# Altium project Breakout_Board_PAC5527.PrjPcb (part 1 of 2)
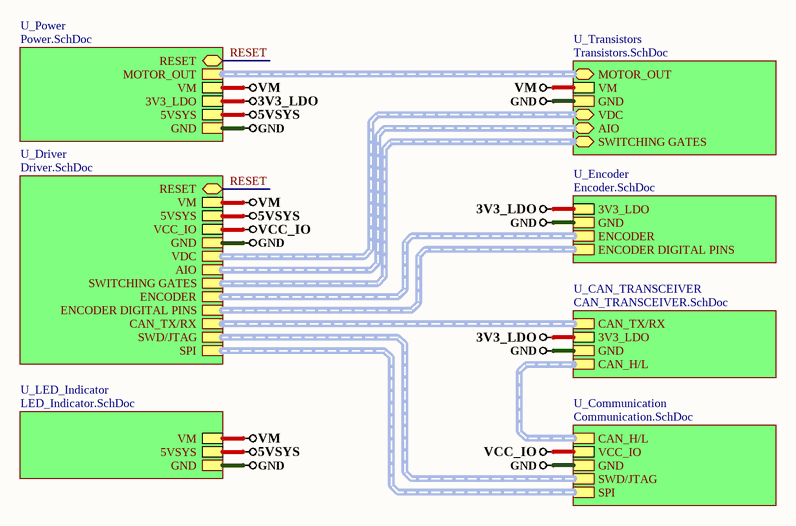
[diagram p0: Top_Sheet.SchDoc]
8 sheets, 84 parts. Net scope: hierarchical (ports join the sheet entries above them; power ports are global).
Board file: BOB_PAC5527.PcbDoc
Sheets:
  Top_Sheet.SchDoc
    U_Communication = Communication.SchDoc
    U_LED_Indicator = LED_Indicator.SchDoc
    U_Transistors = Transistors.SchDoc
    U_CAN_TRANSCEIVER = CAN_TRANSCEIVER.SchDoc
    U_Power = Power.SchDoc
    U_Encoder = Encoder.SchDoc
    U_Driver = Driver.SchDoc

## Sheet Top_Sheet.SchDoc
size A4; DocumentNumber: 8; SheetNumber: 1; SheetTotal: 8

### Sub-sheets
U_CAN_TRANSCEIVER = CAN_TRANSCEIVER.SchDoc: CAN_H/L (harness CAN_H/L), CAN_TX/RX (harness CAN_TXRX), GND, 3V3_LDO
U_Communication = Communication.SchDoc: SWD/JTAG (harness SWD/JTAG), SPI (harness SPI), GND, VCC_IO, CAN_H/L (harness CAN_H/L)
U_Driver = Driver.SchDoc: SWITCHING GATES (harness SWITCHING GATES), AIO (harness AIO), GND, SWD/JTAG (harness SWD/JTAG), CAN_TX/RX (harness CAN_TX/RX), VCC_IO, VDC (harness VDC), 5VSYS, VM, RESET (bidir), SPI (harness SPI), ENCODER (harness ENCODER), ENCODER DIGITAL PINS (harness ENCODER DIGITAL PINS)
U_Encoder = Encoder.SchDoc: GND, 3V3_LDO, ENCODER (harness ENCODER), ENCODER DIGITAL PINS (harness ENCODER DIGITAL PINS)
U_LED_Indicator = LED_Indicator.SchDoc: 5VSYS, GND, VM
U_Power = Power.SchDoc: GND, VM, MOTOR_OUT (harness MOTOR_OUT), RESET (bidir), 3V3_LDO, 5VSYS
U_Transistors = Transistors.SchDoc: MOTOR_OUT (bidir, harness MOTOR_OUT), VDC (bidir, harness VDC), GND, VM, AIO (bidir, harness AIO), SWITCHING GATES (bidir, harness SWITCHING GATES)

### Nets
3V3_LDO: sheet U_CAN_TRANSCEIVER/3V3_LDO, sheet U_Power/3V3_LDO, sheet U_Encoder/3V3_LDO
5VSYS: sheet U_LED_Indicator/5VSYS, sheet U_Power/5VSYS, sheet U_Driver/5VSYS
GND: sheet U_Communication/GND, sheet U_LED_Indicator/GND, sheet U_Transistors/GND, sheet U_CAN_TRANSCEIVER/GND, sheet U_Power/GND, sheet U_Encoder/GND, sheet U_Driver/GND
VCC_IO: sheet U_Communication/VCC_IO, sheet U_Driver/VCC_IO
VM: sheet U_LED_Indicator/VM, sheet U_Transistors/VM, sheet U_Power/VM, sheet U_Driver/VM
RESET: sheet U_Power/RESET, sheet U_Driver/RESET

### Buses and harness runs
harness sheet U_CAN_TRANSCEIVER/CAN_H/L = sheet U_Communication/CAN_H/L
harness sheet U_CAN_TRANSCEIVER/CAN_TX/RX = sheet U_Driver/CAN_TX/RX
harness sheet U_Communication/SPI = sheet U_Driver/SPI
harness sheet U_Communication/SWD/JTAG = sheet U_Driver/SWD/JTAG
harness sheet U_Driver/AIO = sheet U_Transistors/AIO
harness sheet U_Driver/ENCODER = sheet U_Encoder/ENCODER
harness sheet U_Driver/ENCODER DIGITAL PINS = sheet U_Encoder/ENCODER DIGITAL PINS
harness sheet U_Driver/SWITCHING GATES = sheet U_Transistors/SWITCHING GATES
harness sheet U_Driver/VDC = sheet U_Transistors/VDC
harness sheet U_Power/MOTOR_OUT = sheet U_Transistors/MOTOR_OUT

### Notes on the sheet
- File:
- Title:
- Date:
- Page
- Num:
- Total:
- Drawn By: Huzaifa Ali

## Sheet Communication.SchDoc
size A4; DocumentNumber: 4; SheetNumber: 5; SheetTotal: 8
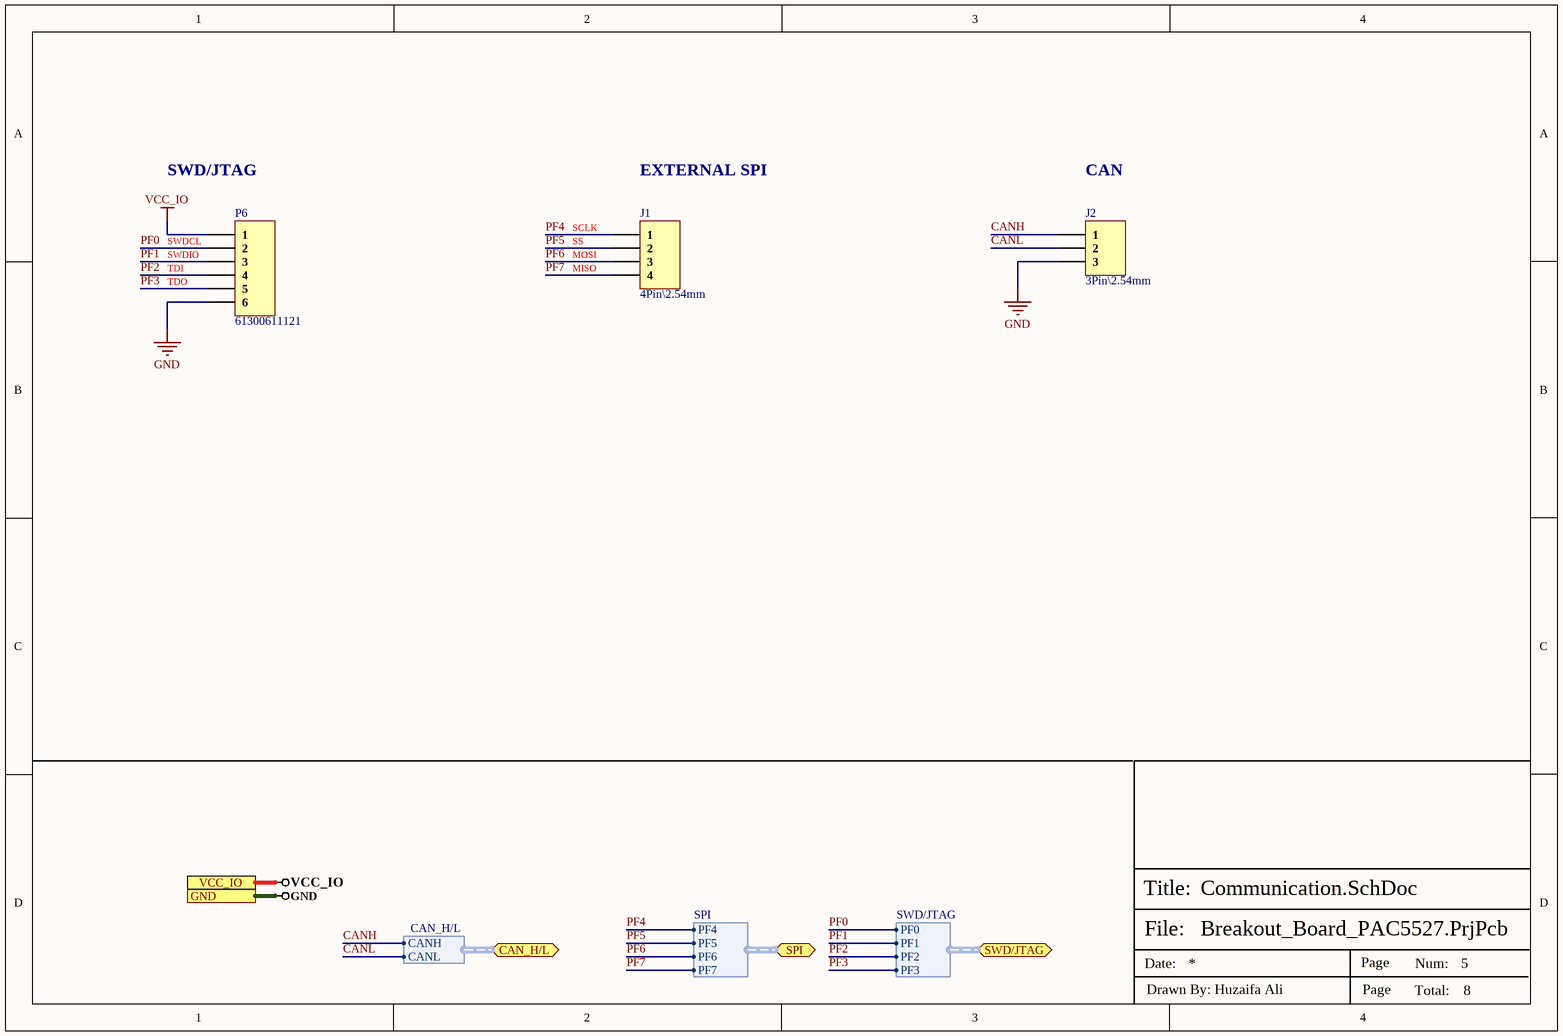
[diagram p1: Communication.SchDoc]

### Parts
J1  4Pin\2.54mm  [HDR1X4_]
J2  3Pin\2.54mm  [HDR1X3_]
P6  61300611121  [HDR1X6_]

### Ports
CAN_H/L (bidir, harness CAN_H/L), GND, SPI (bidir, harness SPI), SWD/JTAG (bidir, harness SWD/JTAG), VCC_IO

### Harnesses
SWD/JTAG: PF0, PF1, PF2, PF3
SPI: PF4, PF5, PF6, PF7
CAN_H/L: CANH, CANL

### Nets
GND: J2.3 P6.6 ; port GND
VCC_IO: P6.1 ; port VCC_IO
CANH: J2.1 ; port CAN_H/L.CANH
CANL: J2.2 ; port CAN_H/L.CANL
PF0: P6.2 ; port SWD/JTAG.PF0
PF1: P6.3 ; port SWD/JTAG.PF1
PF2: P6.4 ; port SWD/JTAG.PF2
PF3: P6.5 ; port SWD/JTAG.PF3
PF4: J1.1 ; port SPI.PF4
PF5: J1.2 ; port SPI.PF5
PF6: J1.3 ; port SPI.PF6
PF7: J1.4 ; port SPI.PF7

### Notes on the sheet
- SWD/JTAG
- EXTERNAL SPI
- CAN
- (near P6) SWDCL
- SS
- (near J1) SCLK
- (near P6) SWDIO
- (near P6) TDO
- (near P6) TDI
- (near J1) MISO
- (near J1) MOSI
- File:
- Title:
- Date:
- Page
- Num:
- Total:
- Drawn By: Huzaifa Ali

### Library data of the parts
J1 = B-2100S04P-A110: Straight 2.54mm 6mm -40℃~+105℃ 3mm 4 2.54mm 单排 Black Brass 1x4P Plugin,P=2.54mm Pin Headers ROHS; Manufacturer: Ckmtw; Item Type: Header; LCSC Part Number: C124378; Manufacturer Part Number: B-2100S04P-A110
J2 = B-2100S03P-A110: Straight 2.54mm Black Brass 1x3P Plugin,P=2.54mm Pin Headers ROHS; Manufacturer: Ckmtw; Item Type: Header; LCSC Part Number: C124376; Manufacturer Part Number: B-2100S03P-A110
P6 = 61300611121: CONN HEADER 6 POS 2.54; Manufacturer: Wurth Electronics; Current Rating: 3A; Voltage Rating: 250V; Number of Positions: 6; Gender: Male; Connector Type: Male Pin; Pitch: 0.1inch; Supplier 1: Newark; Manufacturer Part Number: 61300611121; RoHS: Yes; Category: Headers and Wire Housings; Stock 1: 4996; Pricing 1: 1=0.34000, 10=0.28900, 25=0.24000, 50=0.20100, 100=0.18200 (USD); Mount: Through Hole; Contact Plating: Gold; Contact Material: Copper Alloy,Copper; Housing Material: PBT; Color: Black; Min Operating Temperature: -40°C; Max Operating Temperature: 125°C; Number of Rows: 1; Contact Gender: Male; Packaging: Bulk; Termination: Through Hole; Number of Contacts: 6; Series: WR-PHD; Contact Type: Male Pin; Contact Mating Length: 0.236inch; REACH SVHC: Unknown; Lead Free: Lead Free; RoHS Compliant: Yes; ComponentLink1URL: http://www.mouser.com/ds/2/445/6130xx11121-538006.pdf?src-supplier=Mouser; ComponentLink1Description: http://www.mouser.com/ds/2/445/6130xx11121-538006.pdf?src-supplier=Mouser; ComponentLink2URL: http://www.farnell.com/cad/1737268.pdf?src-supplier=Element14; ComponentLink2Description: http://www.farnell.com/cad/1737268.pdf?src-supplier=Element14; ComponentLink3URL: https://katalog.we-online.de/em/datasheet/6130xx11121.pdf?src-supplier=Digi-Key; ComponentLink3Description: https://katalog.we-online.de/em/datasheet/6130xx11121.pdf?src-supplier=Digi-Key; Supplier Part Number 1: 20X0957

## Sheet LED_Indicator.SchDoc
size A4; DocumentNumber: 6; SheetNumber: 7; SheetTotal: 8
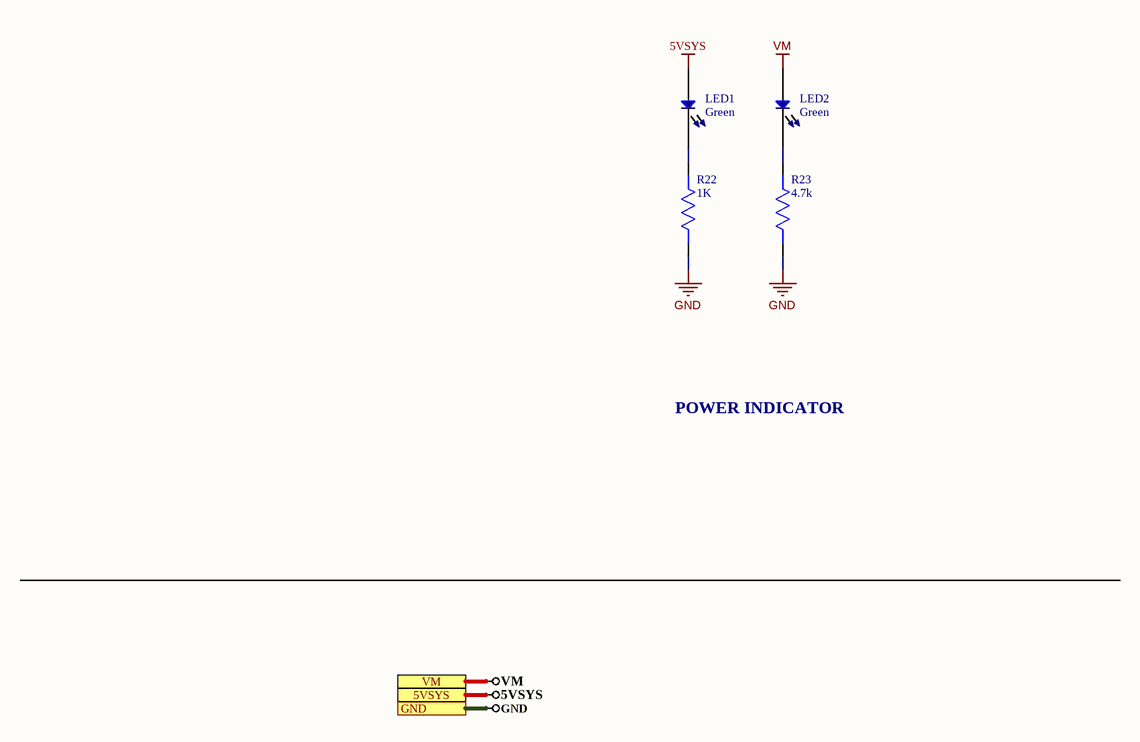
[diagram p2: LED_Indicator.SchDoc]

### Parts
LED1  Green  [LED-0402]
LED2  Green  [LED-0402]
R22  1K  [Res-0402]
R23  4.7k  [RES-0805]

### Ports
5VSYS, GND, VM

### Nets
5VSYS: LED1.1 ; port 5VSYS
GND: R22.2 R23.2 ; port GND
VM: LED2.1 ; port VM
NetLED1_2: LED1.2 R22.1
NetLED2_2: LED2.2 R23.1

### Notes on the sheet
- POWER INDICATOR
- File:
- Title:
- Date:
- Page
- Num:
- Total:
- Drawn By: Huzaifa Ali

### Library data of the parts
LED1 LED2 = 16-213/GHC-YR1S1/3T: Green 520~535nm 0402 Light Emitting Diodes (LED) RoHS; Manufacturer: Everlight Elec; Luminous Intensity (IF=20mA): 112~285mcd; Package: 0402; Illumination Color: Green; Dominant Wavelength / Coordinate rank: 520~535nm; Mounting Type: Surface Mount; Manufacturer Part Number: 16-213/GHC-YR1S1/3T; ComponentLink1Description: LCSC; ComponentLink1URL: https://www.lcsc.com/product-detail/Light-Emitting-Diodes-LED_Everlight-Elec-16-213-GHC-YR1S1-3T_C74338.html; LCSC Part Number: C74338
R22 = ERJ-2GEJ102X: RES SMD 1K OHM 5% 1/10W 0402; Manufacturer: Panasonic; Temperature Coefficient: 200ppm/°C; Working Voltage: 50V; Power: 100mW; Rated Temperature: 70°C; Value: 1kR; Package Height: 0.35mm; Package Length: 1mm; Package Width: 0.5mm; Reference Standard: AEC-Q200; Item Type: Resistor; Supplier 1: Rs; Manufacturer Part Number: ERJ-2GEJ102X; Stock 1: 600000; Pricing 1: 10000=0.00400, 30000=0.00300 (GBP); Case/Package: 0402; Min Operating Temperature: -55°C; Max Operating Temperature: 155°C; Tolerance: 5%; Packaging: Tape and Reel; Termination: Wraparound; ComponentLink1URL: https://datasheet.ciiva.com:443/pdfs/VipMasterIC/IC/PANA/PANA-S-A0009891627/PANA-S-A0009891627-1.pdf?src-supplier=IHS+Markit; ComponentLink1Description: https://datasheet.ciiva.com:443/pdfs/VipMasterIC/IC/PANA/PANA-S-A0009891627/PANA-S-A0009891627-1.pdf?src-supplier=IHS+Markit; ComponentLink2URL: https://datasheet.ciiva.com/34303/1986781-34303542.pdf?src-supplier=Jameco; ComponentLink2Description: https://datasheet.ciiva.com/34303/1986781-34303542.pdf?src-supplier=Jameco; ComponentLink3URL: https://datasheet.ciiva.com/11821/0900766b80f806dd-11821202.pdf?src-supplier=Rs; ComponentLink3Description: https://datasheet.ciiva.com/11821/0900766b80f806dd-11821202.pdf?src-supplier=Rs; ComponentLink4URL: https://datasheet.ciiva.com/43460/1500035-43460379.pdf?src-supplier=Farnell; ComponentLink4Description: https://datasheet.ciiva.com/43460/1500035-43460379.pdf?src-supplier=Farnell; ComponentLink5URL: https://datasheet.ciiva.com/46386/1500035-46386458.pdf?src-supplier=Element14; ComponentLink5Description: https://datasheet.ciiva.com/46386/1500035-46386458.pdf?src-supplier=Element14; ComponentLink6URL: https://datasheet.ciiva.com/22783/1500035-22783817.pdf?src-supplier=Farnell; ComponentLink6Description: https://datasheet.ciiva.com/22783/1500035-22783817.pdf?src-supplier=Farnell; ComponentLink7URL: https://datasheet.ciiva.com/46371/1500035-46371935.pdf?src-supplier=Element14; ComponentLink7Description: https://datasheet.ciiva.com/46371/1500035-46371935.pdf?src-supplier=Element14; ComponentLink8URL: https://datasheet.ciiva.com/16762/70260739-16762170.pdf?src-supplier=Allied+Electronics; ComponentLink8Description: https://datasheet.ciiva.com/16762/70260739-16762170.pdf?src-supplier=Allied+Electronics; ComponentLink9URL: https://datasheet.ciiva.com/16199/aoa0000ce1-16199541.pdf?src-supplier=Future+Electronics; ComponentLink9Description: https://datasheet.ciiva.com/16199/aoa0000ce1-16199541.pdf?src-supplier=Future+Electronics; Supplier Part Number 1: 7324867; RoHS: Yes; Category: Chip SMD Resistors; Mounting Technology: Surface Mount; Pins: 2; Package Shape: Rectangular; Terminal Finish: Nickel; JESD-609 Code: e3; Resistor Type: FIXED RESISTOR; Construction: Rectangular; Package Style: SMTMeter; Technology: METAL GLAZE/THICK FILM; Reach SVHC Compliant: Yes; RoHS Compliant: Yes; ComponentLink10URL: https://datasheet.ciiva.com/48531/aoa0000ce1-48531081.pdf?src-supplier=Avnet; ComponentLink10Description: https://datasheet.ciiva.com/48531/aoa0000ce1-48531081.pdf?src-supplier=Avnet; ComponentLink11URL: https://datasheet.ciiva.com/30219/4aoa0000ce1-30219159.pdf?src-supplier=Onlinecomponents.com; ComponentLink11Description: https://datasheet.ciiva.com/30219/4aoa0000ce1-30219159.pdf?src-supplier=Onlinecomponents.com; LCSC Part Number: *
R23 = CRCW08054K70FKEAHP: Res Thick Film 0805 4.7K Ohm 1% 0.5W ±100ppm/°C Molded SMD SMD Paper T/R; Manufacturer: Vishay; Power Rating: 330mW; Voltage Rating: 150V; Resistance: 4.7kR; Max Power Dissipation: 500mW; Item Type: Resistor; Supplier 1: RSComponents; Manufacturer Part Number: CRCW08054K70FKEAHP; RoHS: Yes; Category: Chip SMD Resistors; Stock 1: 8150; Pricing 1: 100=0.15700, 250=0.14600, 500=0.13600, 1000=0.12500 (GBP); Mount: Surface Mount; Case/Package: 0805; Weight: 0.000194oz; Case Code (Imperial): 0805; Case Code (Metric): 2012; Contact Plating: Tin; Min Operating Temperature: -55°C; Max Operating Temperature: 155°C; Tolerance: 1%; Packaging: Tape and Reel; Package Quantity: 5000; Resistor Type: Thick Film; Termination: SMD/SMT; Temperature Coefficient: 100ppm/°C; Voltage Rating (DC): 150V; Features: Automotive AEC-Q200; Series: CRCW-HP; Number of Terminations: 2; Resistance Tolerance: 1%; Construction: Rectangular; Technology: THICK FILM; Length: 2mm; Width: 1.2mm; Height: 0.5mm; Depth: 1.25mm; Ratings: AEC-Q200; Radiation Hardening: No; Military Standard: Not; Lead Free: Lead Free; RoHS Compliant: Yes; ComponentLink1URL: https://datasheet.ciiva.com/8079/424479-8079653.pdf?src-supplier=Element14; ComponentLink1Description: https://datasheet.ciiva.com/8079/424479-8079653.pdf?src-supplier=Element14; ComponentLink2URL: https://datasheet.ciiva.com/9072/crcwhpe3-9072073.pdf?src-supplier=Avnet; ComponentLink2Description: https://datasheet.ciiva.com/9072/crcwhpe3-9072073.pdf?src-supplier=Avnet; LCSC Part Number: C313926; Supplier Part Number 1: 8123574P

## Sheet Transistors.SchDoc
size A4; DocumentNumber: 5; SheetNumber: 6; SheetTotal: 8
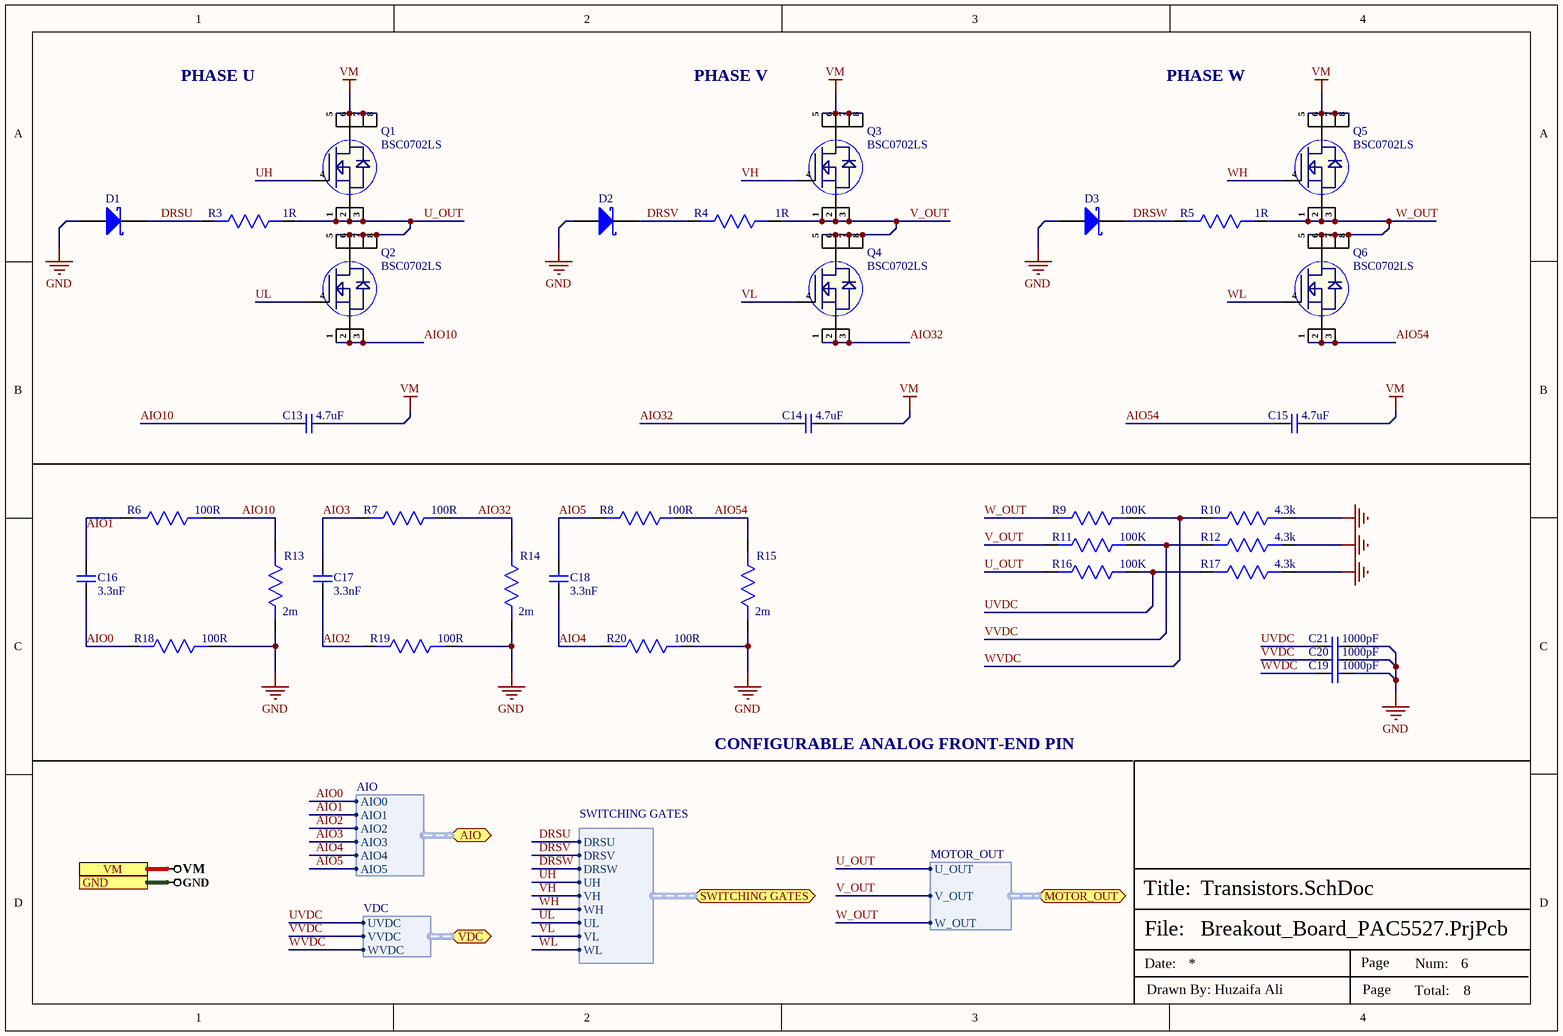
[diagram p3: Transistors.SchDoc]

### Parts
C13  4.7uF  [Cap-0805]
C14  4.7uF  [Cap-0805]
C15  4.7uF  [Cap-0805]
C16  3.3nF  [Cap-0402]
C17  3.3nF  [Cap-0402]
C18  3.3nF  [Cap-0402]
C19  1000pF  [Cap-0402]
C20  1000pF  [Cap-0402]
C21  1000pF  [Cap-0402]
D1  1N4148WS-7-F  [SOD-323]  (value not drawn)
D2  1N4148WS-7-F  [SOD-323]  (value not drawn)
D3  1N4148WS-7-F  [SOD-323]  (value not drawn)
Q1  BSC0702LS  [PG-TDSON-8]
Q2  BSC0702LS  [PG-TDSON-8]
Q3  BSC0702LS  [PG-TDSON-8]
Q4  BSC0702LS  [PG-TDSON-8]
Q5  BSC0702LS  [PG-TDSON-8]
Q6  BSC0702LS  [PG-TDSON-8]
R3  1R  [Res-0402]
R4  1R  [Res-0402]
R5  1R  [Res-0402]
R6  100R  [Res-0402]
R7  100R  [Res-0402]
R8  100R  [Res-0402]
R9  100K  [Res-0402]
R10  4.3k  [Res-0603]
R11  100K  [Res-0402]
R12  4.3k  [Res-0603]
R13  2m  [RES-2512]
R14  2m  [RES-2512]
R15  2m  [RES-2512]
R16  100K  [Res-0402]
R17  4.3k  [Res-0603]
R18  100R  [Res-0402]
R19  100R  [Res-0402]
R20  100R  [Res-0402]

### Ports
AIO (bidir, harness AIO), GND, MOTOR_OUT (bidir, harness MOTOR_OUT), SWITCHING GATES (bidir, harness SWITCHING GATES), VDC (bidir, harness VDC), VM

### Harnesses
MOTOR_OUT: U_OUT, V_OUT, W_OUT
VDC: UVDC, VVDC, WVDC
AIO: AIO0, AIO1, AIO2, AIO3, AIO4, AIO5
SWITCHING GATES: DRSW, VL, DRSV, UH, DRSU, WL, VH, WH, UL

### Nets
GND: C19.1 C20.1 C21.1 D1.2(A) D2.2(A) D3.2(A) R10.2 R12.2 R13.2 R14.2 R15.2 R17.2 R18.1 R19.1 R20.1 ; port GND
VM: C13.2 C14.2 C15.2 Q1.5(D) Q1.6(D) Q1.7(D) Q1.8(D) Q3.5(D) Q3.6(D) Q3.7(D) Q3.8(D) Q5.5(D) Q5.6(D) Q5.7(D) Q5.8(D) ; port VM
AIO0: C16.1 R18.2 ; port AIO.AIO0
AIO1: C16.2 R6.2 ; port AIO.AIO1
AIO2: C17.1 R19.2 ; port AIO.AIO2
AIO3: C17.2 R7.2 ; port AIO.AIO3
AIO4: C18.1 R20.2 ; port AIO.AIO4
AIO5: C18.2 R8.2 ; port AIO.AIO5
AIO10: C13.1 Q2.1(S) Q2.2(S) Q2.3(S) R6.1 R13.1
AIO32: C14.1 Q4.1(S) Q4.2(S) Q4.3(S) R7.1 R14.1
AIO54: C15.1 Q6.1(S) Q6.2(S) Q6.3(S) R8.1 R15.1
DRSU: D1.1(K) R3.2 ; port SWITCHING GATES.DRSU
DRSV: D2.1(K) R4.2 ; port SWITCHING GATES.DRSV
DRSW: D3.1(K) R5.2 ; port SWITCHING GATES.DRSW
U_OUT: Q1.1(S) Q1.2(S) Q1.3(S) Q2.5(D) Q2.6(D) Q2.7(D) Q2.8(D) R3.1 R16.2 ; port MOTOR_OUT.U_OUT
UH: Q1.4(G) ; port SWITCHING GATES.UH
UL: Q2.4(G) ; port SWITCHING GATES.UL
UVDC: C21.2 R16.1 R17.1 ; port VDC.UVDC
V_OUT: Q3.1(S) Q3.2(S) Q3.3(S) Q4.5(D) Q4.6(D) Q4.7(D) Q4.8(D) R4.1 R11.2 ; port MOTOR_OUT.V_OUT
VH: Q3.4(G) ; port SWITCHING GATES.VH
VL: Q4.4(G) ; port SWITCHING GATES.VL
VVDC: C20.2 R11.1 R12.1 ; port VDC.VVDC
W_OUT: Q5.1(S) Q5.2(S) Q5.3(S) Q6.5(D) Q6.6(D) Q6.7(D) Q6.8(D) R5.1 R9.2 ; port MOTOR_OUT.W_OUT
WH: Q5.4(G) ; port SWITCHING GATES.WH
WL: Q6.4(G) ; port SWITCHING GATES.WL
WVDC: C19.2 R9.1 R10.1 ; port VDC.WVDC

### Notes on the sheet
- PHASE U
- PHASE V
- PHASE W
- CONFIGURABLE ANALOG FRONT-END PIN
- File:
- Title:
- Date:
- Page
- Num:
- Total:
- Drawn By: Huzaifa Ali

### Library data of the parts
C13-C15 = GRM21BR61H475KE51L: CAP CER 4.7UF 50V X5R 0805; Manufacturer: Murata; Material: Ceramic; Tolerance: 10%; Item Type: Capacitor; Supplier 1: Rs; Manufacturer Part Number: GRM21BR61H475KE51L; RoHS: Yes; Category: Ceramic Capacitors; Stock 1: 37300; Pricing 1: 500=0.09400, 1000=0.08800, 2000=0.08300, 5000=0.07500 (GBP); Mount: Surface Mount; Case/Package: 0805; Case Code (Metric): 2012; Case Code (Imperial): 0805; Min Operating Temperature: -55°C; Max Operating Temperature: 85°C; Capacitance: 4.7uF; Packaging: Tape and Reel; Dielectric: X5R; Voltage Rating: 50V; Voltage Rating (DC): 50V; Series: GRM; Length: 2mm; Width: 0.049inch; Height: 1.25mm; Thickness: 0.055inch; Depth: 1.25mm; Reach SVHC Compliant: Yes; Lead Free: Lead Free; RoHS Compliant: Yes; ComponentLink1URL: http://www.farnell.com/datasheets/2079186.pdf?src-supplier=Farnell; ComponentLink1Description: http://www.farnell.com/datasheets/2079186.pdf?src-supplier=Farnell; ComponentLink2URL: http://components.arrow.com/part/dataview/61084395S454511N2606?src-supplier=Arrow+Electronics; ComponentLink2Description: http://components.arrow.com/part/dataview/61084395S454511N2606?src-supplier=Arrow+Electronics; ComponentLink3URL: http://www.farnell.com/datasheets/2079186.pdf?src-supplier=Element14; ComponentLink3Description: http://www.farnell.com/datasheets/2079186.pdf?src-supplier=Element14; ComponentLink4URL: http://search.murata.co.jp/Ceramy/image/img/A01X/G101/ENG/GRM21BR61H475KE51-01.pdf?src-supplier=Digi-Key; ComponentLink4Description: http://search.murata.co.jp/Ceramy/image/img/A01X/G101/ENG/GRM21BR61H475KE51-01.pdf?src-supplier=Digi-Key; ComponentLink5URL: https://search.murata.co.jp/Ceramy/image/img/A01X/G101/ENG/GRM21BR61H475KE51-01.pdf?src-supplier=Digi-Key; ComponentLink5Description: https://search.murata.co.jp/Ceramy/image/img/A01X/G101/ENG/GRM21BR61H475KE51-01.pdf?src-supplier=Digi-Key; ComponentLink6URL: http://www.farnell.com/datasheets/2079186.pdf?src-supplier=Newark; ComponentLink6Description: http://www.farnell.com/datasheets/2079186.pdf?src-supplier=Newark; Supplier Part Number 1: 1138707P; LCSC Part Number: C162420
C16-C18 = CC0402KRX7R9BB332: CAP CER 3.3nF 50V X7R 0402; Manufacturer: Yageo; Dielectric Material: Ceramic; Tolerance: 10%; Insulation Resistance: 100GR; Item Type: Capacitor; Supplier 1: Future Electronics; Manufacturer Part Number: CC0402KRX7R9BB332; RoHS: Yes; Category: Ceramic Capacitors; Stock 1: 1190000; Pricing 1: 10000=0.00230, 40000=0.00200, 50000=0.00220, 150000=0.00190, 250000=0.00200, 400000=0.00180, 1000000=0.00190, 2500000=0.00180 (USD); Mount: Surface Mount; Case/Package: 0402; Number of Pins: 2; Case Code (Metric): 1005; Case Code (Imperial): 0402; Min Operating Temperature: -55°C; Max Operating Temperature: 125°C; Capacitance: 3.3nF; Dielectric: X7R; Packaging: Tape and Reel; Voltage Rating: 50V; Voltage Rating (DC): 50V; Package Quantity: 1; Termination: SMD/SMT; Voltage: 50V; Series: CC; Length: 1mm; Width: 0.02inch; Height: 0.5mm; Thickness: 0.022inch; Depth: 0.5mm; Terminal Length: 0.225mm; Radiation Hardening: No; Reach SVHC Compliant: Yes; Lead Free: Lead Free; Halogen Free: Halogen Free; RoHS Compliant: Yes; ComponentLink1URL: https://datasheet.ciiva.com/144/mlccorderingcode-144014.pdf?src-supplier=Digi-Key; ComponentLink1Description: https://datasheet.ciiva.com/144/mlccorderingcode-144014.pdf?src-supplier=Digi-Key; ComponentLink2URL: https://datasheet.ciiva.com/144/mlccorderingcode-144013.pdf?src-supplier=Digi-Key; ComponentLink2Description: https://datasheet.ciiva.com/144/mlccorderingcode-144013.pdf?src-supplier=Digi-Key; ComponentLink3URL: https://datasheet.ciiva.com/144/mlccorderingcode-144015.pdf?src-supplier=Digi-Key; ComponentLink3Description: https://datasheet.ciiva.com/144/mlccorderingcode-144015.pdf?src-supplier=Digi-Key; ComponentLink4URL: https://datasheet.ciiva.com/11786/0900766b80d84f1d-11786153.pdf?src-supplier=Rs; ComponentLink4Description: https://datasheet.ciiva.com/11786/0900766b80d84f1d-11786153.pdf?src-supplier=Rs; ComponentLink5URL: https://datasheet.ciiva.com/7978/1489800-7978103.pdf?src-supplier=Element14; ComponentLink5Description: https://datasheet.ciiva.com/7978/1489800-7978103.pdf?src-supplier=Element14; ComponentLink6URL: https://datasheet.ciiva.com/28450/1489800-28450409.pdf?src-supplier=Element14; ComponentLink6Description: https://datasheet.ciiva.com/28450/1489800-28450409.pdf?src-supplier=Element14; ComponentLink7URL: https://datasheet.ciiva.com/5789/1489800-5789558.pdf?src-supplier=Farnell; ComponentLink7Description: https://datasheet.ciiva.com/5789/1489800-5789558.pdf?src-supplier=Farnell; ComponentLink8URL: https://datasheet.ciiva.com/8033/1489800-8033630.pdf?src-supplier=Element14; ComponentLink8Description: https://datasheet.ciiva.com/8033/1489800-8033630.pdf?src-supplier=Element14; ComponentLink9URL: https://datasheet.ciiva.com/22745/1489800-22745767.pdf?src-supplier=Element14; ComponentLink9Description: https://datasheet.ciiva.com/22745/1489800-22745767.pdf?src-supplier=Element14; ComponentLink10URL: https://datasheet.ciiva.com/5425/upy-gphc-x7r-6-3v-to-50v-8-12304-5425518.pdf?src-supplier=Mouser; ComponentLink10Description: https://datasheet.ciiva.com/5425/upy-gphc-x7r-6-3v-to-50v-8-12304-5425518.pdf?src-supplier=Mouser; ComponentLink11URL: https://datasheet.ciiva.com/11586/upy-gphc-x7r-6-3v-to-50v-8-11586486.pdf?src-supplier=Avnet; ComponentLink11Description: https://datasheet.ciiva.com/11586/upy-gphc-x7r-6-3v-to-50v-8-11586486.pdf?src-supplier=Avnet; ComponentLink12URL: https://datasheet.ciiva.com/15189/getdatasheetpartid-315557-15189133.pdf?src-supplier=Verical; ComponentLink12Description: https://datasheet.ciiva.com/15189/getdatasheetpartid-315557-15189133.pdf?src-supplier=Verical; Supplier Part Number 1: 9776550; LCSC Part Number: C107028
C19-C21 = 885012205080: CAP CER 1000PF 100V X7R 0402; Manufacturer: Wurth Electronics; Supplier 1: Digi-Key; Manufacturer Part Number: 885012205080; RoHS: Yes; Stock 1: 13604; Pricing 1: 1=0.10000, 10=0.01900, 100=0.01730, 500=0.01532 (USD); ComponentLink1URL: https://katalog.we-online.de/pbs/datasheet/885012205080.pdf?src-supplier=Digi-Key; ComponentLink1Description: https://katalog.we-online.de/pbs/datasheet/885012205080.pdf?src-supplier=Digi-Key; Supplier Part Number 1: 732-12243-1-ND; LCSC Part Number: C2176546
D1-D3 = 1N4148WS-7-F: DIODE GEN PURP 75V 150MA SOD323; Manufacturer: Diodes; Forward Current: 300mA; Reverse Recovery Time: 4ns; Element Configuration: Single; Forward Voltage: 1.25V; Max Reverse Current: 1uA; Peak Non-Repetitive Surge Current: 2A; Power Dissipation: 200mW; Polarity: Standard; Capacitance: 2pF; Supplier 1: Mouser; Manufacturer Part Number: 1N4148WS-7-F; RoHS: Yes; Category: Rectifier Diodes; Pricing 1: 1=0.19000, 10=0.17500, 50=0.17500, 100=0.09600, 500=0.05900, 1000=0.04000, 3000=0.03000, 9000=0.02600, 10000=0.02600, 24000=0.02300, 45000=0.01900 (USD); Mount: Surface Mount; Number of Pins: 2; Weight: 0.000173oz; Contact Plating: Tin,Matte; Min Operating Temperature: -65°C; Max Operating Temperature: 150°C; Max Repetitive Reverse Voltage (Vrrm): 75V; Max Forward Surge Current (Ifsm): 2A; Max Surge Current: 2A; Packaging: Tape and Reel; Recovery Time: 4ns; Package Quantity: 3000; Average Rectified Current: 150mA; Voltage Rating (DC): 75V; Power Rating: 200mW; Current Rating: 150mA; Output Current: 150mA; Voltage: 75V; Max Reverse Voltage (DC): 75V; Series: -; Reverse Recovery Time-Max: 4ns; Length: 1.8mm; Width: 1.4mm; Height: 1mm; Radiation Hardening: No; REACH SVHC: No SVHC; Lead Free: Lead Free; RoHS Compliant: Yes; ComponentLink1URL: https://datasheet.ciiva.com/1179/ds30097-1179355.pdf?src-supplier=Element14; ComponentLink1Description: https://datasheet.ciiva.com/1179/ds30097-1179355.pdf?src-supplier=Element14; ComponentLink2URL: https://datasheet.ciiva.com/8300/ds30097-8300396.pdf?src-supplier=Avnet; ComponentLink2Description: https://datasheet.ciiva.com/8300/ds30097-8300396.pdf?src-supplier=Avnet; ComponentLink3URL: https://datasheet.ciiva.com/16199/ds30097-16199061.pdf?src-supplier=Future+Electronics; ComponentLink3Description: https://datasheet.ciiva.com/16199/ds30097-16199061.pdf?src-supplier=Future+Electronics; ComponentLink4URL: https://datasheet.ciiva.com/911/ds30097-911742.pdf?src-supplier=Digi-Key; ComponentLink4Description: https://datasheet.ciiva.com/911/ds30097-911742.pdf?src-supplier=Digi-Key; ComponentLink5URL: https://datasheet.ciiva.com/911/ds30097-911743.pdf?src-supplier=Digi-Key; ComponentLink5Description: https://datasheet.ciiva.com/911/ds30097-911743.pdf?src-supplier=Digi-Key; ComponentLink6URL: https://datasheet.ciiva.com/911/ds30097-911741.pdf?src-supplier=Digi-Key; ComponentLink6Description: https://datasheet.ciiva.com/911/ds30097-911741.pdf?src-supplier=Digi-Key; Supplier Part Number 1: 621-1N4148WS-F; LCSC Part Number: C60580
Q1-Q6 = BSC0702LS: MOSFET N-CH 60V 100A SUPERSO8; Manufacturer: Infineon; Manufacturer Part Number: BSC0702LSATMA1; Item Type: Transistor; Supplier 1: Digi-Key; RoHS: No; Category: MOSFETs; Stock 1: 9380; Pricing 1: 1=1.88000, 10=1.69000, 100=1.35800, 500=1.11572, 1000=0.92978 (USD); LCSC Part Number: C501503; Supplier Part Number 1: 448-BSC0702LSATMA1CT-ND; ComponentLink1Description: LCSC; ComponentLink1URL: https://www.lcsc.com/product-detail/MOSFETs_Infineon-Technologies-BSC0702LS_C501503.html
R3-R5 = RC0402FR-071RL: RES 1 OHM 1% 1/16W 0402; Manufacturer: Yageo; Power Rating: 62.5mW; Voltage Rating: 50V; Temperature Coefficient: 200ppm/°C; Max Power Dissipation: 63mW; Supplier 1: Mouser; Manufacturer Part Number: RC0402FR-071RL; RoHS: Yes; Category: Chip SMD Resistors; Stock 1: 239284; Pricing 1: 1=0.10000, 10=0.02200, 50=0.02200, 100=0.00900, 1000=0.00400, 10000=0.00200 (USD); Case/Package: 0402; Case Code (Imperial): 0402; Case Code (Metric): 1005; Min Operating Temperature: -55°C; Max Operating Temperature: 155°C; Resistance: 1R; Tolerance: 1%; Packaging: Tape and Reel; Termination: SMD/SMT; Resistor Type: Thick Film; Voltage Rating (DC): 50V; Working Voltage: 50V; Number of Terminations: 2; Features: Moisture Resistant; Series: RC; Construction: Rectangular; Technology: THICK FILM; Resistance Tolerance: 1%; Length: 1mm; Height: 0.32mm; Depth: 0.5mm; REACH SVHC: No SVHC; Military Standard: Not; Lead Free: Lead Free; RoHS Compliant: Yes; ComponentLink1URL: https://datasheet.ciiva.com/11808/0900766b80c66297-11808794.pdf?src-supplier=RSComponents; ComponentLink1Description: https://datasheet.ciiva.com/11808/0900766b80c66297-11808794.pdf?src-supplier=RSComponents; ComponentLink2URL: https://datasheet.ciiva.com/7849/1018594-7849895.pdf?src-supplier=Element14; ComponentLink2Description: https://datasheet.ciiva.com/7849/1018594-7849895.pdf?src-supplier=Element14; ComponentLink3URL: https://datasheet.ciiva.com/7849/1018594-7849894.pdf?src-supplier=Element14; ComponentLink3Description: https://datasheet.ciiva.com/7849/1018594-7849894.pdf?src-supplier=Element14; ComponentLink4URL: https://datasheet.ciiva.com/46394/1018594-46394952.pdf?src-supplier=Element14; ComponentLink4Description: https://datasheet.ciiva.com/46394/1018594-46394952.pdf?src-supplier=Element14; ComponentLink5URL: https://datasheet.ciiva.com/12667/pyu-rc0402-51-rohs-l-6-r-12667915.pdf?src-supplier=Mouser; ComponentLink5Description: https://datasheet.ciiva.com/12667/pyu-rc0402-51-rohs-l-6-r-12667915.pdf?src-supplier=Mouser; ComponentLink6URL: https://datasheet.ciiva.com/16740/pyu-rc0402-51-rohs-l-6-r-16740903.pdf?src-supplier=Future+Electronics; ComponentLink6Description: https://datasheet.ciiva.com/16740/pyu-rc0402-51-rohs-l-6-r-16740903.pdf?src-supplier=Future+Electronics; Supplier Part Number 1: 603-RC0402FR-071RL; LCSC Part Number: C185446
R6-R8 R18-R20 = RC0402FR-07100RL: RES 100 OHM 1% 1/16W 0402; Manufacturer: Yageo; Power Rating: 62.5mW; Voltage Rating: 50V; Temperature Coefficient: 100ppm/°C; Max Power Dissipation: 63mW; Supplier 1: Mouser; Manufacturer Part Number: RC0402FR-07100RL; RoHS: Yes; Category: Chip SMD Resistors; Stock 1: 699545; Pricing 1: 1=0.10000, 10=0.01200, 50=0.01200, 100=0.00500, 1000=0.00300, 2500=0.00200, 10000=0.00100 (USD); Case/Package: 0402; Number of Pins: 2; Case Code (Imperial): 0402; Case Code (Metric): 1005; Size Code: 0402; Min Operating Temperature: -55°C; Max Operating Temperature: 155°C; Tolerance: 1%; Voltage Rating (DC): 50V; Resistance: 100R; Packaging: Tape and Reel; Termination: SMD/SMT; Resistor Type: Thick Film; Features: Moisture Resistant; Series: RC; Number of Terminations: 2; Resistance Tolerance: 1%; Construction: Rectangular; Technology: THICK FILM; Length: 1mm; Width: 0.5mm; Height: 0.32mm; Depth: 0.5mm; RoHS Compliant: Yes; REACH SVHC: No SVHC; Military Standard: Not; Lead Free: Lead Free; ComponentLink1URL: https://datasheet.ciiva.com/11808/0900766b80c66297-11808765.pdf?src-supplier=RSComponents; ComponentLink1Description: https://datasheet.ciiva.com/11808/0900766b80c66297-11808765.pdf?src-supplier=RSComponents; ComponentLink2URL: https://datasheet.ciiva.com/7849/1784430-7849810.pdf?src-supplier=Element14; ComponentLink2Description: https://datasheet.ciiva.com/7849/1784430-7849810.pdf?src-supplier=Element14; ComponentLink3URL: https://datasheet.ciiva.com/28367/1018594-28367226.pdf?src-supplier=Element14; ComponentLink3Description: https://datasheet.ciiva.com/28367/1018594-28367226.pdf?src-supplier=Element14; ComponentLink4URL: https://datasheet.ciiva.com/22747/1018594-22747511.pdf?src-supplier=Element14; ComponentLink4Description: https://datasheet.ciiva.com/22747/1018594-22747511.pdf?src-supplier=Element14; ComponentLink5URL: https://datasheet.ciiva.com/12667/pyu-rc0402-51-rohs-l-6-r-12667957.pdf?src-supplier=Mouser; ComponentLink5Description: https://datasheet.ciiva.com/12667/pyu-rc0402-51-rohs-l-6-r-12667957.pdf?src-supplier=Mouser; ComponentLink6URL: https://datasheet.ciiva.com/15189/getdatasheetpartid-329466-15189335.pdf?src-supplier=Verical; ComponentLink6Description: https://datasheet.ciiva.com/15189/getdatasheetpartid-329466-15189335.pdf?src-supplier=Verical; ComponentLink7URL: https://datasheet.ciiva.com/16740/pyu-rc0402-51-rohs-l-6-r-16740566.pdf?src-supplier=Future+Electronics; ComponentLink7Description: https://datasheet.ciiva.com/16740/pyu-rc0402-51-rohs-l-6-r-16740566.pdf?src-supplier=Future+Electronics; Supplier Part Number 1: 603-RC0402FR-07100RL; LCSC Part Number: C106232
R9 R11 R16 = RC0402FR-07100KL: RES 100K OHM 1% 1/16W 0402; Manufacturer: Yageo; Resistance: 100kR; Temperature Coefficient: 100ppm/°C; Power Rating: 63mW; Voltage Rating: 50V; Item Type: Resistor; Supplier 1: Mouser; Manufacturer Part Number: RC0402FR-07100KL; RoHS: Yes; Category: Chip SMD Resistors; Stock 1: 7759549; Pricing 1: 1=0.10000, 10=0.01200, 50=0.01200, 100=0.00500, 1000=0.00300, 2500=0.00200, 10000=0.00100 (USD); Case/Package: 0402; Case Code (Metric): 1005; Case Code (Imperial): 0402; Min Operating Temperature: -55°C; Max Operating Temperature: 155°C; Resistor Type: Thick Film; Tolerance: 1%; Packaging: Tape and Reel; Package Quantity: 1; Number of Terminations: 2; Termination: SMD/SMT; Max Power Dissipation: 63mW; Working Voltage: 50V; Features: Moisture Resistant; Series: RC; Resistance Tolerance: 1%; Construction: Rectangular; Technology: THICK FILM; Length: 0.039inch; Width: 0.02inch; Height: 0.016inch; Depth: 0.5mm; REACH SVHC: No SVHC; Lead Free: Lead Free; RoHS Compliant: Yes; Military Standard: Not; ComponentLink1URL: https://datasheet.ciiva.com/11819/0900766b80c66297-11819452.pdf?src-supplier=RSComponents; ComponentLink1Description: https://datasheet.ciiva.com/11819/0900766b80c66297-11819452.pdf?src-supplier=RSComponents; ComponentLink2URL: https://datasheet.ciiva.com/22747/1018594-22747509.pdf?src-supplier=Element14; ComponentLink2Description: https://datasheet.ciiva.com/22747/1018594-22747509.pdf?src-supplier=Element14; ComponentLink3URL: https://datasheet.ciiva.com/2453/pyu-r-int-thick-7-2453362.pdf?src-supplier=Digi-Key; ComponentLink3Description: https://datasheet.ciiva.com/2453/pyu-r-int-thick-7-2453362.pdf?src-supplier=Digi-Key; ComponentLink4URL: https://datasheet.ciiva.com/2453/pyu-r-int-thick-7-2453363.pdf?src-supplier=Digi-Key; ComponentLink4Description: https://datasheet.ciiva.com/2453/pyu-r-int-thick-7-2453363.pdf?src-supplier=Digi-Key; ComponentLink5URL: https://datasheet.ciiva.com/2453/pyu-r-int-thick-7-2453361.pdf?src-supplier=Digi-Key; ComponentLink5Description: https://datasheet.ciiva.com/2453/pyu-r-int-thick-7-2453361.pdf?src-supplier=Digi-Key; ComponentLink6URL: https://datasheet.ciiva.com/12667/pyu-rc0402-51-rohs-l-6-r-12667930.pdf?src-supplier=Mouser; ComponentLink6Description: https://datasheet.ciiva.com/12667/pyu-rc0402-51-rohs-l-6-r-12667930.pdf?src-supplier=Mouser; ComponentLink7URL: https://datasheet.ciiva.com/15189/getdatasheetpartid-323696-15189334.pdf?src-supplier=Verical; ComponentLink7Description: https://datasheet.ciiva.com/15189/getdatasheetpartid-323696-15189334.pdf?src-supplier=Verical; Supplier Part Number 1: 603-RC0402FR-07100KL; LCSC Part Number: C60491
R10 R12 R17 = AR03BTCX4301: RES 4.3K OHM 0.1% 1/10W 0603; Manufacturer: Viking Tech; Item Type: Resistor; LCSC Part Number: C2828647; Manufacturer Part Number: AR03BTCX4301; Package: 0603; ComponentLink1Description: LCSC; ComponentLink1URL: https://www.lcsc.com/product-detail/Chip-Resistor-Surface-Mount_Viking-Tech-AR03BTCX4301_C2828647.html
R13-R15 = PA2512FKF7T0R002E: Res 2512 0.002 Ohm 1% 3W ±100ppm/C Epoxy Pad SMD Automotive T/R; Manufacturer: Yageo; Resistance: 2mR; Temperature Coefficient: 100ppm/°C; Item Type: Resistor; Supplier 1: Mouser; Manufacturer Part Number: PA2512FKF7T0R002E; RoHS: Yes; Category: Chip SMD Resistors; Stock 1: 5437; Pricing 1: 1=0.78000, 10=0.67800, 50=0.52800, 100=0.45900, 1000=0.29400, 10000=0.29400 (USD); Case/Package: 2512; Min Operating Temperature: -55°C; Max Operating Temperature: 170°C; Package Quantity: 4000; Packaging: Tape and Reel; Resistor Type: Thin Film; Number of Terminations: 2; Tolerance: 1%; Max Power Dissipation: 3W; Features: Moisture Resistant,Automotive AEC-Q200; Length: 0.25inch; Width: 0.125inch; Height: 0.035inch; RoHS Compliant: Yes; ComponentLink1URL: http://www.mouser.com/ds/2/447/PYu-PA_E_51_RoHS_5-1077983.pdf?src-supplier=Mouser; ComponentLink1Description: http://www.mouser.com/ds/2/447/PYu-PA_E_51_RoHS_5-1077983.pdf?src-supplier=Mouser; ComponentLink2URL: http://www.yageo.com/documents/recent/PYu-PA_E_51_RoHS_7.pdf?src-supplier=Digi-Key; ComponentLink2Description: http://www.yageo.com/documents/recent/PYu-PA_E_51_RoHS_7.pdf?src-supplier=Digi-Key; Supplier Part Number 1: 603-PA2512FKF7T0R002; LCSC Part Number: C728320

## Sheet CAN_TRANSCEIVER.SchDoc
size A4; DocumentNumber: 7; SheetNumber: 8; SheetTotal: 8
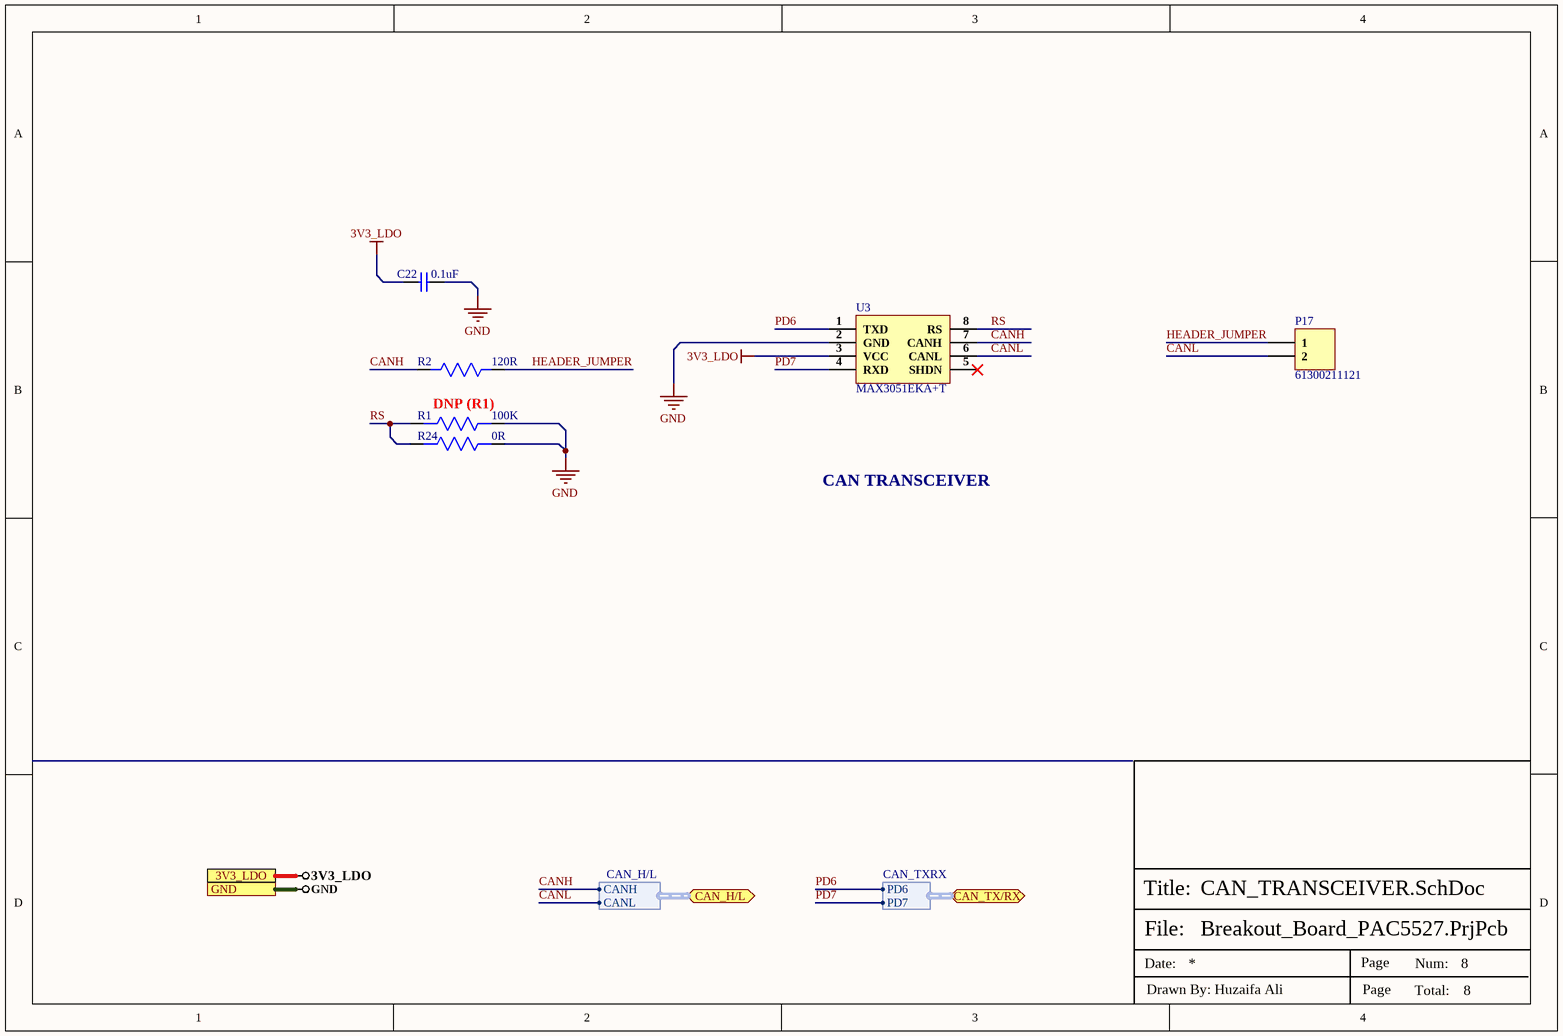
[diagram p4: CAN_TRANSCEIVER.SchDoc]

### Parts
C22  0.1uF  [Cap-0402]
P17  61300211121  [HDR1X2_]
R1  100K  [RES-0603]
R2  120R  [Res-0603]
R24  0R  [Res-0603]
U3  MAX3051EKA+T  [SOT-23-8]

### Ports
3V3_LDO, CAN_H/L (bidir, harness CAN_H/L), CAN_TX/RX (bidir, harness CAN_TXRX), GND

### Harnesses
CAN_H/L: CANH, CANL
CAN_TXRX: PD6, PD7

### Nets
3V3_LDO: C22.1 U3.3(VCC) ; port 3V3_LDO
GND: C22.2 R1.1 R24.1 U3.2(GND) ; port GND
CANH: R2.1 U3.7(CANH) ; port CAN_H/L.CANH
CANL: P17.2 U3.6(CANL) ; port CAN_H/L.CANL
HEADER_JUMPER: P17.1 R2.2
PD6: U3.1(TXD) ; port CAN_TX/RX.PD6
PD7: U3.4(RXD) ; port CAN_TX/RX.PD7
RS: R1.2 R24.2 U3.8(RS)

Not connected (* = marked no-connect by the designer): U3 5(SHDN)*

### Notes on the sheet
- (near R1) DNP (R1)
- CAN TRANSCEIVER
- File:
- Title:
- Date:
- Page
- Num:
- Total:
- Drawn By: Huzaifa Ali

### Library data of the parts
C22 = GRM155R62A104KE14D: CAP CER 0.1UF 100V X5R 0402; Manufacturer: Murata; Capacitance: 100nF; Tolerance: 10%; Item Type: Capacitor; Supplier 1: Arrow Electronics; Manufacturer Part Number: GRM155R62A104KE14D; RoHS: Yes; Category: Ceramic Capacitors; Stock 1: 870000; Pricing 1: 10000=0.00500, 20000=0.00410, 30000=0.00390, 50000=0.00370, 100000=0.00300 (USD); Mount: Surface Mount; Case/Package: 0402; Case Code (Metric): 1005; Case Code (Imperial): 0402; Weight: 0.000212oz; Min Operating Temperature: -55°C; Max Operating Temperature: 85°C; Packaging: Tape and Reel; Voltage Rating: 100V; Dielectric: X5R; Termination: SMD/SMT; Voltage Rating (DC): 100V; Package Quantity: 10000; Series: GRM; Length: 0.039inch; Width: 0.02inch; Height: 0.5mm; Thickness: 0.022inch; Reach SVHC Compliant: Yes; Lead Free: Lead Free; RoHS Compliant: Yes; ComponentLink1URL: http://www.farnell.com/datasheets/2079151.pdf?src-supplier=Farnell; ComponentLink1Description: http://www.farnell.com/datasheets/2079151.pdf?src-supplier=Farnell; ComponentLink2URL: http://www.mouser.com/ds/2/281/c02e-2905.pdf?src-supplier=Mouser; ComponentLink2Description: http://www.mouser.com/ds/2/281/c02e-2905.pdf?src-supplier=Mouser; ComponentLink3URL: http://www.farnell.com/datasheets/2079151.pdf?src-supplier=Element14; ComponentLink3Description: http://www.farnell.com/datasheets/2079151.pdf?src-supplier=Element14; ComponentLink4URL: http://search.murata.co.jp/Ceramy/image/img/A01X/G101/ENG/GRM155R62A104KE14-01.pdf?src-supplier=Digi-Key; ComponentLink4Description: http://search.murata.co.jp/Ceramy/image/img/A01X/G101/ENG/GRM155R62A104KE14-01.pdf?src-supplier=Digi-Key; ComponentLink5URL: http://www.farnell.com/datasheets/2079151.pdf?src-supplier=Newark; ComponentLink5Description: http://www.farnell.com/datasheets/2079151.pdf?src-supplier=Newark; Supplier Part Number 1: GRM155R62A104KE14D; LCSC Part Number: C162178
P17 = 61300211121: CONN HEADER VERT 2POS 2.54MM; Manufacturer: Wurth Electronics; Current Rating: 3A; Voltage Rating: 250V; Number of Positions: 2; Gender: Male; Connector Type: Male Pin; Pitch: 0.1inch; Supplier 1: Digi-Key; Manufacturer Part Number: 61300211121; Stock 1: 219205; Pricing 1: 1=0.13, 10=0.106, 25=0.088, 50=0.074, 100=0.067, 1000=0.061 (USD); Mount: Through Hole; Contact Plating: Gold; Housing Material: PBT; Contact Material: Copper Alloy,Copper; Color: Black; Min Operating Temperature: -40°C; Max Operating Temperature: 125°C; Number of Rows: 1; Contact Gender: Male; Packaging: Bulk; Termination: Through Hole; Number of Contacts: 2; Contact Mating Length: 0.236inch; REACH SVHC: Unknown; Lead Free: Lead Free; ComponentLink1URL: http://www.mouser.com/ds/2/445/6130xx11121-538006.pdf?src-supplier=Mouser; ComponentLink1Description: http://www.mouser.com/ds/2/445/6130xx11121-538006.pdf?src-supplier=Mouser; Supplier Part Number 1: 732-5315-ND
R1 = CRGH0603J100K: RES SMD 100K OHM 5% 1/5W 0603; Manufacturer: TE Connectivity; Resistance: 100kR; Temperature Coefficient: 100ppm/°C; Power Rating: 200mW; Voltage Rating: 50V; Number of Resistors: 1; Supplier 1: Digi-Key; Manufacturer Part Number: CRGH0603J100K; Stock 1: 23277; Pricing 1: 1=0.1, 10=0.049, 100=0.02, 1000=0.00899, 2500=0.0078 (USD); Mount: Surface Mount; Case/Package: 0603; Case Code (Imperial): 0603; Case Code (Metric): 1608; Min Operating Temperature: -55°C; Max Operating Temperature: 125°C; Tolerance: 5%; Packaging: Tape and Reel; Resistor Type: Thick Film,Power resistor; Number of Terminations: 2; Series: CRGH; Termination: Solder; Voltage Rating (DC): 50V; Resistance Tolerance: 5%; Technology: THICK FILM; Length: 1.6mm; Width: 0.8mm; Height: 0.45mm; Depth: 0.8mm; RoHS Compliant: Yes; REACH SVHC: No SVHC; ELV: Compliant; ComponentLink1URL: http://www.farnell.com/datasheets/2007183.pdf?src-supplier=Element14; ComponentLink1Description: http://www.farnell.com/datasheets/2007183.pdf?src-supplier=Element14; Supplier Part Number 1: A126393DKR-ND; LCSC Part Number: C2074142
R2 = RC0603FR-07120RL: RES 120 OHM 1% 1/10W 0603; Manufacturer: Yageo; Temperature Coefficient: 100ppm/°C; Voltage Rating (DC): 50V; Power Rating: 100mW; Supplier 1: Digi-Key; Manufacturer Part Number: RC0603FR-07120RL; RoHS: Yes; Category: Chip SMD Resistors; Stock 1: 839061; Pricing 1: 1=0.10000, 10=0.02400, 100=0.00970, 1000=0.00436, 2500=0.00378 (USD); Case/Package: 0603; Number of Pins: 2; Case Code (Metric): 1608; Case Code (Imperial): 0603; Size Code: 0603; Min Operating Temperature: -55°C; Max Operating Temperature: 155°C; Resistance: 120R; Tolerance: 1%; Resistor Type: Thick Film; Packaging: Tape and Reel; Voltage Rating: 50V; Package Quantity: 1; Number of Terminations: 2; Termination: SMD/SMT; Max Power Dissipation: 100mW; Features: Moisture Resistant; Series: RC; Construction: Rectangular; Resistance Tolerance: 1%; Length: 1.6mm; Width: 0.031inch; Height: 0.022inch; Depth: 0.8mm; REACH SVHC: No SVHC; Lead Free: Lead Free; Military Standard: Not; RoHS Compliant: Yes; ComponentLink1URL: https://datasheet.ciiva.com/2553/pyu-r-int-thick-7-2553512.pdf?src-supplier=Digi-Key; ComponentLink1Description: https://datasheet.ciiva.com/2553/pyu-r-int-thick-7-2553512.pdf?src-supplier=Digi-Key; ComponentLink2URL: https://datasheet.ciiva.com/7746/443971-7746248.pdf?src-supplier=Element14; ComponentLink2Description: https://datasheet.ciiva.com/7746/443971-7746248.pdf?src-supplier=Element14; ComponentLink3URL: https://datasheet.ciiva.com/2553/pyu-r-int-thick-7-2553513.pdf?src-supplier=Digi-Key; ComponentLink3Description: https://datasheet.ciiva.com/2553/pyu-r-int-thick-7-2553513.pdf?src-supplier=Digi-Key; ComponentLink4URL: https://datasheet.ciiva.com/7746/443971-7746249.pdf?src-supplier=Element14; ComponentLink4Description: https://datasheet.ciiva.com/7746/443971-7746249.pdf?src-supplier=Element14; ComponentLink5URL: https://datasheet.ciiva.com/2553/pyu-r-int-thick-7-2553514.pdf?src-supplier=Digi-Key; ComponentLink5Description: https://datasheet.ciiva.com/2553/pyu-r-int-thick-7-2553514.pdf?src-supplier=Digi-Key; ComponentLink6URL: https://datasheet.ciiva.com/46395/443971-46395021.pdf?src-supplier=Element14; ComponentLink6Description: https://datasheet.ciiva.com/46395/443971-46395021.pdf?src-supplier=Element14; Supplier Part Number 1: 311-120HRCT-ND; LCSC Part Number: C114640
R24 = RC0603JR-070RL: RES 0 OHM JUMPER 1/10W 0603; Manufacturer: Yageo; Resistance: 0mR; Tolerance: 1%; Power Rating: 100mW; Voltage Rating (DC): 50V; Temperature Coefficient: 200ppm/°C; Resistance Tolerance: 5%; Supplier 1: Digi-Key; Manufacturer Part Number: RC0603JR-070RL; RoHS: Yes; Category: Chip SMD Resistors; Stock 1: 18081776; Pricing 1: 1=0.10000, 10=0.01700, 25=0.01240, 50=0.00960, 100=0.00700, 250=0.00536, 500=0.00430, 1000=0.00316 (USD); Case/Package: 0603; Number of Pins: 2; Contact Plating: Tin,Matte; Case Code (Imperial): 0603; Case Code (Metric): 1608; Size Code: 0603; Min Operating Temperature: -55°C; Max Operating Temperature: 155°C; Resistor Type: Thick Film; Packaging: Tape and Reel; Termination: SMD/SMT; Series: RC; Technology: THICK FILM; Package Quantity: 5000; Voltage Rating: 50V; Features: Moisture Resistant; Max Power Dissipation: 100mW; Number of Terminations: 2; Construction: Rectangular; Length: 1.6mm; Width: 0.8mm; Height: 0.45mm; Depth: 0.8mm; Radiation Hardening: No; Reach SVHC Compliant: No SVHC; Lead Free: Lead Free; RoHS Compliant: Yes; Military Standard: Not; Supplier Part Number 1: 311-0.0GRCT-ND
U3 = MAX3051EKA+T: IC TXRX CAN 3.3V SOT23-8; Manufacturer: Maxim; Max Supply Voltage: 3.465V; Min Supply Voltage: 3.135V; Data Rate: 1Mbps; Operating Supply Current: 35mA; Number of Transceivers: 1; Max Supply Current: 70mA; Supplier 1: Mouser; Manufacturer Part Number: MAX3051EKA+T; RoHS: Yes; Category: Interface ICs; Stock 1: 31750; Pricing 1: 1=3.87000, 10=3.47000, 50=3.28000, 100=2.85000, 1000=2.19000, 10000=2.11000 (USD); Mount: Surface Mount; Number of Pins: 8; Contact Plating: Tin,Matte; Weight: 0.01787oz; Min Operating Temperature: -40°C; Max Operating Temperature: 85°C; Packaging: Tape and Reel; Package Quantity: 1; Interface: CAN; Number of Transmit Buffers: 1; Number of Receive Buffers: 1; Operating Supply Voltage: 3.3V; Series: -; Length: 2.9mm; Width: 1.625mm; Height: 1.25mm; Radiation Hardening: No; RoHS Compliant: Yes; ComponentLink1URL: https://datasheet.ciiva.com/12072/max3051-74908-12072588.pdf?src-supplier=Mouser; ComponentLink1Description: https://datasheet.ciiva.com/12072/max3051-74908-12072588.pdf?src-supplier=Mouser; ComponentLink2URL: https://datasheet.ciiva.com/1711/max3051-1711846.pdf?src-supplier=Digi-Key; ComponentLink2Description: https://datasheet.ciiva.com/1711/max3051-1711846.pdf?src-supplier=Digi-Key; ComponentLink3URL: https://datasheet.ciiva.com/1711/max3051-1711847.pdf?src-supplier=Digi-Key; ComponentLink3Description: https://datasheet.ciiva.com/1711/max3051-1711847.pdf?src-supplier=Digi-Key; ComponentLink4URL: https://datasheet.ciiva.com/1711/max3051-1711845.pdf?src-supplier=Digi-Key; ComponentLink4Description: https://datasheet.ciiva.com/1711/max3051-1711845.pdf?src-supplier=Digi-Key; Supplier Part Number 1: 700-MAX3051EKAT; Package: SOT-23-8; LCSC Part Number: C112005; Item Type: IC

## Sheet Power.SchDoc
size A4; DocumentNumber: 2; SheetNumber: 3; SheetTotal: 8
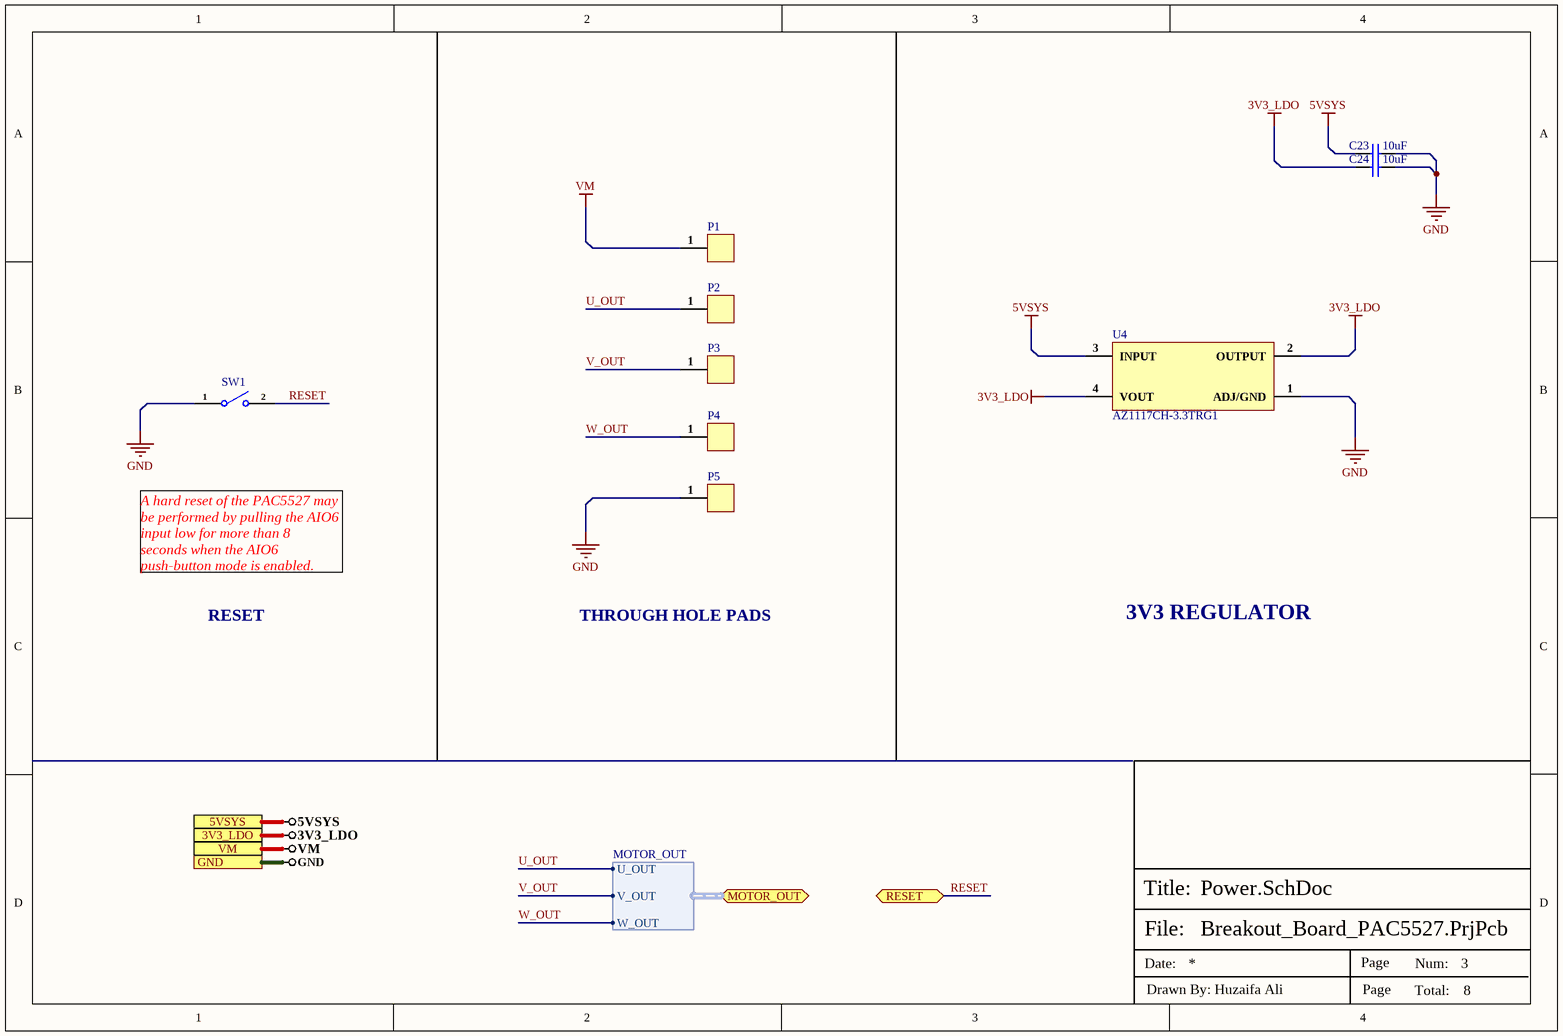
[diagram p5: Power.SchDoc]

### Parts
C23  10uF  [Cap-0402]
C24  10uF  [Cap-0402]
P1  Through_Hole_Pad  [Through Hole Pad (High Power)_]  (value not drawn)
P2  Through_Hole_Pad  [Through Hole Pad (High Power)_]  (value not drawn)
P3  Through_Hole_Pad  [Through Hole Pad (High Power)_]  (value not drawn)
P4  Through_Hole_Pad  [Through Hole Pad (High Power)_]  (value not drawn)
P5  Through_Hole_Pad  [Through Hole Pad (High Power)_]  (value not drawn)
SW1  TS-1185EC-C-D-B  [TS-1185EC-C-D-B_]  (value not drawn)
U4  AZ1117CH-3.3TRG1  [SOT- 223]

### Ports
3V3_LDO, 5VSYS, GND, MOTOR_OUT (bidir, harness MOTOR_OUT), RESET (bidir), VM

### Harnesses
MOTOR_OUT: U_OUT, V_OUT, W_OUT

### Nets
3V3_LDO: C24.1 U4.2(OUTPUT) U4.4(VOUT) ; port 3V3_LDO
5VSYS: C23.1 U4.3(INPUT) ; port 5VSYS
GND: C23.2 C24.2 P5.1 SW1.1 U4.1(ADJ/GND) ; port GND
VM: P1.1 ; port VM
RESET: SW1.2 ; port RESET
U_OUT: P2.1 ; port MOTOR_OUT.U_OUT
V_OUT: P3.1 ; port MOTOR_OUT.V_OUT
W_OUT: P4.1 ; port MOTOR_OUT.W_OUT

### Notes on the sheet
- A hard reset of the PAC5527 may be performed by pulling the AIO6 input low for more than 8
  seconds when the AIO6 push-button mode is enabled.
- RESET
- THROUGH HOLE PADS
- 3V3 REGULATOR
- File:
- Title:
- Date:
- Page
- Num:
- Total:
- Drawn By: Huzaifa Ali

### Library data of the parts
C23 C24 = CC0402MRX5R6BB106: CAP CER 10UF 10V X5R 0402; Manufacturer: Yageo; Tolerance: 20%; Item Type: Capacitor; Supplier 1: Future Electronics; Manufacturer Part Number: CC0402MRX5R6BB106; RoHS: Yes; Category: Ceramic Capacitors; Stock 1: 80000; Pricing 1: 10000=0.02650, 20000=0.02590, 30000=0.02550, 40000=0.02530, 50000=0.02450 (USD); Mount: Surface Mount; Case/Package: 0402; Case Code (Imperial): 0402; Case Code (Metric): 1005; Min Operating Temperature: -55°C; Max Operating Temperature: 85°C; Packaging: Tape and Reel; Capacitance: 10uF; Voltage Rating: 10V; RoHS Compliant: Yes; ComponentLink1URL: http://www.yageo.com/documents/recent/UPY-GPHC_X5R_4V-to-50V_25.pdf?src-supplier=Digi-Key; ComponentLink1Description: http://www.yageo.com/documents/recent/UPY-GPHC_X5R_4V-to-50V_25.pdf?src-supplier=Digi-Key; Supplier Part Number 1: 6097631; LCSC Part Number: C962143
P1-P5 = Through_Hole_Pad: Wire Connecting Pad
SW1 = TS-1185EC-C-D-B: 3mm 2mm Round Button 50mA Top3.65mm SPST 12V SMD Tactile Switches; Manufacturer: XKB; Manufacturer Part Number: TS-1185EC-C-D-B; Footprint: Custom; ComponentLink1Description: LCSC; ComponentLink1URL: https://lcsc.com/product-detail/Tactile-Switches_XKB-Connectivity-TS-1185EC-C-D-B_C318893.html; LCSC Part Number: C318893
U4 = AZ1117CH-3.3TRG1: 15V 1.3V @ 800mA Fixed 3.3V SOT-223 Linear Voltage Regulators (LDO) ROHS; Manufacturer: Diodes Incorporated; Item Type: IC; Manufacturer Part Number: AZ1117CH-3.3TRG1; Package: SOT-223; LCSC Part Number: C92102

## Sheet Encoder.SchDoc
size A4; DocumentNumber: 3; SheetNumber: 4; SheetTotal: 8
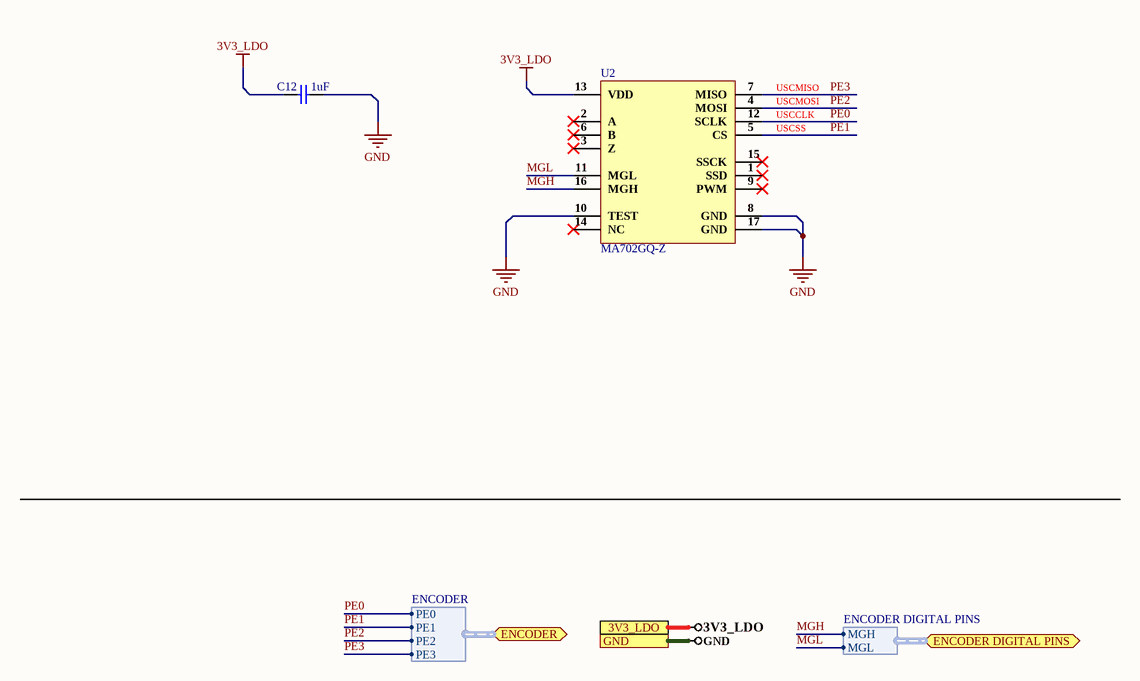
[diagram p6: Encoder.SchDoc]

### Parts
C12  1uF  [Cap-0603]
U2  MA702GQ-Z  [16-QFN (3x3).]

### Ports
3V3_LDO, ENCODER (bidir, harness ENCODER), ENCODER DIGITAL PINS (bidir, harness ENCODER DIGITAL PINS), GND

### Harnesses
ENCODER: PE0, PE1, PE2, PE3
ENCODER DIGITAL PINS: MGH, MGL

### Nets
3V3_LDO: C12.1 U2.13(VDD) ; port 3V3_LDO
GND: C12.2 U2.8(GND) U2.10(TEST) U2.17(GND) ; port GND
MGH: U2.16(MGH) ; port ENCODER DIGITAL PINS.MGH
MGL: U2.11(MGL) ; port ENCODER DIGITAL PINS.MGL
PE0: U2.12(SCLK) ; port ENCODER.PE0
PE1: U2.5(CS) ; port ENCODER.PE1
PE2: U2.4(MOSI) ; port ENCODER.PE2
PE3: U2.7(MISO) ; port ENCODER.PE3

Not connected (* = marked no-connect by the designer): U2 1(SSD)* 2(A)* 3(Z)* 6(B)* 9(PWM)* 14(NC)* 15(SSCK)*

### Notes on the sheet
- (near U2) USCCLK
- (near U2) USCMOSI
- (near U2) USCMISO
- (near U2) USCSS
- File:
- Title:
- Date:
- Page
- Num:
- Total:
- Drawn By: Huzaifa Ali

### Library data of the parts
C12 = UMK107AB7105KA-T: CAP CER 1UF 50V X7R 0603; Manufacturer: Taiyo Yuden; Tolerance: 10%; ComponentLink1URL: http://www.farnell.com/datasheets/2048165.pdf?src-supplier=Element14; ComponentLink1Description: http://www.farnell.com/datasheets/2048165.pdf?src-supplier=Element14; ComponentLink2URL: https://www.murata.com/~/media/webrenewal/support/library/catalog/products/capacitor/mlcc/c02e.ashx?la=en-us&src-supplier=Digi-Key; ComponentLink2Description: https://www.murata.com/~/media/webrenewal/support/library/catalog/products/capacitor/mlcc/c02e.ashx?la=en-us&src-supplier=Digi-Key; Supplier 1: Digi-Key; Manufacturer Part Number: UMK107AB7105KA-T; Stock 1: 453098; Pricing 1: 1=0.28, 10=0.19, 100=0.1079, 500=0.0762, 1000=0.0667 (USD); Mount: Surface Mount; Case/Package: 0603; Case Code (Metric): 1608; Case Code (Imperial): 0603; Min Operating Temperature: -55°C; Max Operating Temperature: 125°C; Packaging: Tape and Reel; Package Quantity: 1; Capacitance: 1uF; Voltage Rating: 50V; Voltage Rating (DC): 50V; Dielectric: X7R; Termination: SMD/SMT; Length: 1.6mm; Height: 0.8mm; Width: 0.031inch; Thickness: 0.037inch; Depth: 0.8mm; Radiation Hardening: No; Halogen Free: Halogen Free; ComponentLink3URL: https://www.yuden.co.jp/productdata/catalog/mlcc_all_e.pdf?src-supplier=Digi-Key; ComponentLink3Description: https://www.yuden.co.jp/productdata/catalog/mlcc_all_e.pdf?src-supplier=Digi-Key; ComponentLink4URL: https://www.yuden.co.jp/productdata/catalog/mlcc_all_e.pdf?src-supplier=Onlinecomponents.com; ComponentLink4Description: https://www.yuden.co.jp/productdata/catalog/mlcc_all_e.pdf?src-supplier=Onlinecomponents.com; Supplier Part Number 1: 587-3247-1-ND; LCSC Part Number: C105174
U2 = MA702GQ-Z: SENSOR ANGLE SMD; Manufacturer: Monolithic Power Systems; Sensing Method: Hall Effect; Frequency: 26MHz; Frequency Stability: 10ppm; Max Supply Current: 7mA; Item Type: IC; Supplier 1: Avnet; Manufacturer Part Number: MA702GQ-Z; RoHS: Yes; Stock 1: 110000; Pricing 1: 5000=3.15000, 10000=2.97500, 20000=2.80000, 30000=2.62500, 40000=2.45000 (USD); Mount: Surface Mount; Case/Package: QFN; Min Operating Temperature: -40°C; Max Operating Temperature: 85°C; Packaging: Tape and Reel; Termination: SMD/SMT; RoHS Compliant: Yes; ComponentLink1URL: https://www.monolithicpower.com/pub/media/document/m/a/ma702_r1.0.pdf?src-supplier=Digi-Key; ComponentLink1Description: https://www.monolithicpower.com/pub/media/document/m/a/ma702_r1.0.pdf?src-supplier=Digi-Key; Supplier Part Number 1: MA702GQ-Z